# Altium schematic sheet Acorn_Podulator_A4.SchDoc
size A3; SheetNumber: 1; SheetTotal: 1
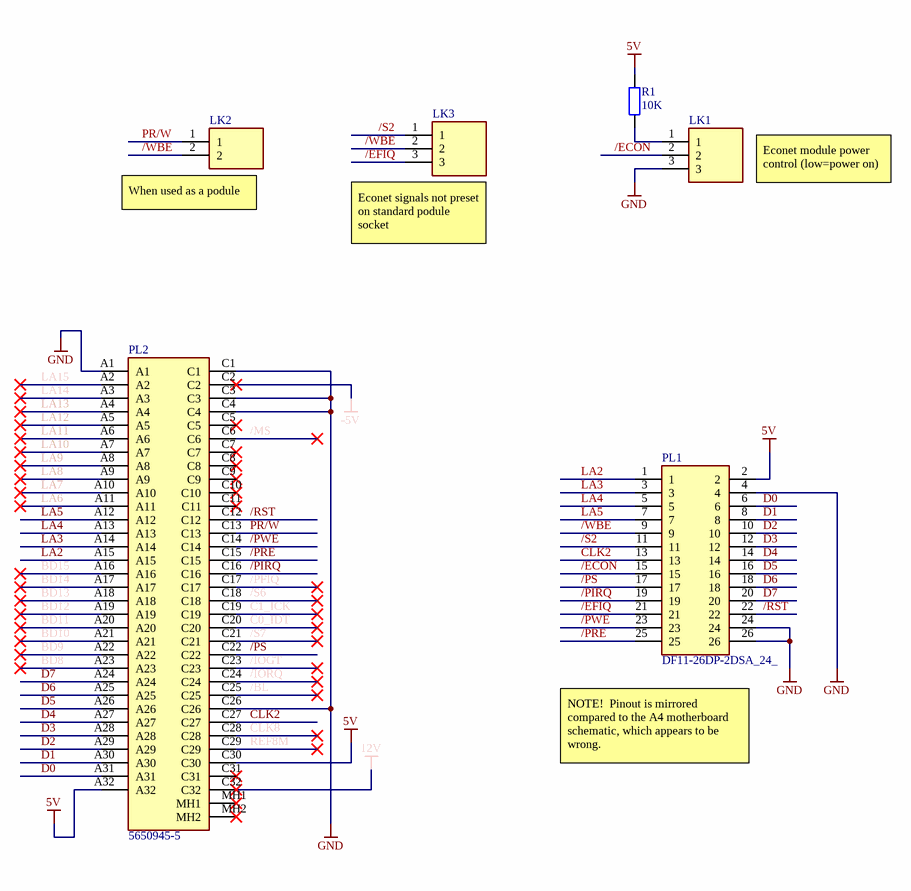
[diagram p0: Acorn_Podulator_A4.SchDoc]

## Parts
LK1  PREC003SAAN-RC  [HDRV3W64P0X254_1X3_762X254X868P]  (value not drawn)
LK2  PREC002SAAN-RC  [HDRV2W64P0X254_1X2_508X254X854P]  (value not drawn)
LK3  M20-7820346  [RHDR3W70P0X254_1X3_802X250X850P]  (value not drawn)
PL1  DF11-26DP-2DSA_24_  [SHDR26W60P200_2X13_2800X500X690P]
PL2  5650945-5  [56509455]
R1  10K  [RES 0603]

## Nets
5V: PL1.2 PL2.A32 PL2.C30 R1.1
12V: PL2.C32
-5V: PL2.C2
GND: LK1.3 PL1.4 PL1.24 PL1.26 PL2.A1 PL2.C1 PL2.C3 PL2.C4 PL2.C26
/BL: PL2.C25
/ECON: LK1.2 PL1.15
/EFIQ: LK3.3 PL1.21
/IOGT: PL2.C23
/IORQ: PL2.C24
/MS: PL2.C6
/PFIQ: PL2.C17
/PIRQ: PL1.19 PL2.C16
/PRE: PL1.25 PL2.C15
/PS: PL1.17 PL2.C22
/PWE: PL1.23 PL2.C14
/RST: PL1.22 PL2.C12
/S2: LK3.1 PL1.11
/S6: PL2.C18
/S7: PL2.C21
/WBE: LK2.2 LK3.2 PL1.9
BD8: PL2.A23
BD9: PL2.A22
BD10: PL2.A21
BD11: PL2.A20
BD12: PL2.A19
BD13: PL2.A18
BD14: PL2.A17
BD15: PL2.A16
C0_IDT: PL2.C20
C1_ICK: PL2.C19
CLK2: PL1.13 PL2.C27
CLK8: PL2.C28
D0: PL1.6 PL2.A31
D1: PL1.8 PL2.A30
D2: PL1.10 PL2.A29
D3: PL1.12 PL2.A28
D4: PL1.14 PL2.A27
D5: PL1.16 PL2.A26
D6: PL1.18 PL2.A25
D7: PL1.20 PL2.A24
LA2: PL1.1 PL2.A15
LA3: PL1.3 PL2.A14
LA4: PL1.5 PL2.A13
LA5: PL1.7 PL2.A12
LA6: PL2.A11
LA7: PL2.A10
LA8: PL2.A9
LA9: PL2.A8
LA10: PL2.A7
LA11: PL2.A6
LA12: PL2.A5
LA13: PL2.A4
LA14: PL2.A3
LA15: PL2.A2
PR/W: LK2.1 PL2.C13
REF8M: PL2.C29
NetLK1_1: LK1.1 R1.2

Not connected (* = marked no-connect by the designer): PL2 C5* C7* C8* C9* C10* C11* C31* MH1* MH2*

## Notes on the sheet
- (near LK2) When used as a podule
- Econet module power control (low=power on)
- (near LK3) Econet signals not preset on standard podule socket
- (near PL1) NOTE!  Pinout is mirrored compared to the A4 motherboard schematic, which appears to be wrong.
- SIZE
- DIMENSIONS
- TITLE
- VARIANT
- REVISION
- DATE
- A3
- SHEET
- OF
- FILE
- DRAWN BY

## Library data of the parts
LK1 = PREC003SAAN-RC: Connector; Manufacturer_Name: Sullins; Datasheet Link: https://media.digikey.com/PDF/Data%20Sheets/Sullins%20PDFs/z%20RzCzzzSzzN-RC,%20ST,11635-B.pdf; Height: 8.68mm; Manufacturer_Part_Number: PREC003SAAN-RC
LK2 = PREC002SAAN-RC: Connector; Manufacturer_Name: Sullins; Datasheet Link: https://drawings-pdf.s3.amazonaws.com/11635.pdf; Height: 8.54mm; Manufacturer_Part_Number: PREC002SAAN-RC
LK3 = M20-7820346: Connector; Manufacturer_Name: Harwin; Datasheet Link: https://content.harwin.com/m/c2ac50ebb1c800d5/original/DRG-00385-Technical-Drawing-Datasheet-M20-782-pdf.pdf; Height: 8.5mm; Manufacturer_Part_Number: M20-7820346; Mouser Part Number: 855-M20-7820346; Mouser Price/Stock: https://www.mouser.co.uk/ProductDetail/Harwin/M20-7820346?qs=vF78I%252BjhbY%252BngA3JRz8Iyw%3D%3D
PL1 = DF11-26DP-2DSA_24_: Connector; Manufacturer_Name: Hirose; Manufacturer_Part_Number: DF11-26DP-2DSA(24); Datasheet Link: https://www.hirose.com/product/en/products/DF11/DF11-26DP-2DSA%2824%29/; Height: 6.9mm; Mouser Part Number: 798-DF11-26DP-2DSA24; Mouser Price/Stock: https://www.mouser.co.uk/ProductDetail/Hirose-Connector/DF11-26DP-2DSA24?qs=zOgoZG1CgI91EYYyNVwN2g%3D%3D
PL2 = 5650945-5: Connector; Manufacturer_Name: TE Connectivity; Datasheet Link: https://www.te.com/commerce/DocumentDelivery/DDEController?Action=showdoc&DocId=Customer+Drawing%7F650473%7FS%7Fpdf%7FEnglish%7FENG_CD_650473_S_baseFilename.pdf%7F5650945-5; Height: 11.1mm; Manufacturer_Part_Number: 5650945-5; Mouser Part Number: 571-5650945-5; Mouser Price/Stock: https://www.mouser.co.uk/ProductDetail/TE-Connectivity/5650945-5?qs=%2FFe7VTH785B%252B77b5t925bQ%3D%3D; Arrow Part Number: 5650945-5; Arrow Price/Stock: https://www.arrow.com/en/products/5650945-5/te-connectivity
R1 = RES_10K_0603_1PCT_0: RES 10K, 0603, 1/10W, 1%, +/-50PPM; Manufacturer1: EUROHM; ManuPart1: P9B1ERR1000; ManuPart2: RC0603FR-0710KL; Value: 10K; Distributor1: Anglia; Manufacturer2: Yageo; Distributor2: Digikey; Distributor1 Part No: RB103; Distributor2 Part No: 311-10.0KHRTR-ND; ComponentLinknURL: *; ComponentLink1Description: ComponentLinknURL1; ComponentLink1URL: http://resources.anglia.com/pdf/product/eur/datasheets/smr_series(2).pdf; ComponentLink2Description: ComponentLinknURL2; ComponentLink2URL: https://www.yageo.com/upload/media/product/productsearch/datasheet/rchip/PYu-RC_Group_51_RoHS_L_10.pdf; Tolerance: 1%